# Altium schematic sheet Filtr_220.SchDoc
size B; SheetNumber: 8; SheetTotal: 9
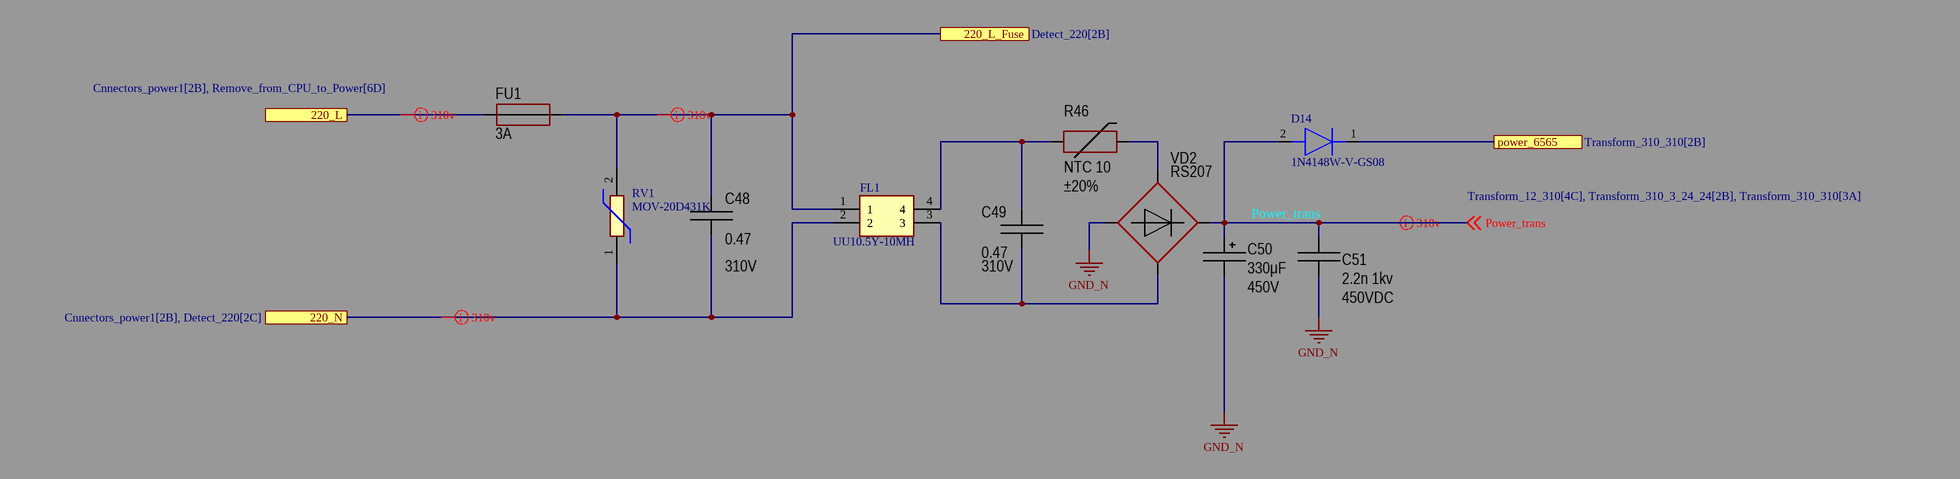
[diagram p0: Filtr_220.SchDoc]

## Parts
C48  value 0.47  Voltage: 310V  [CAP: B32922 (18x7x12.5mm)]
C49  value 0.47  Voltage: 310V  [CAP: B32922 (18x7x12.5mm)]
C50  value 330μF  Voltage: 450V  [CAP: D25C10H50]
C51  value 2.2n 1kv  Voltage: 450VDC  [CAP: AY2102M29Y5US63L7]
D14  1N4148W-V-GS08  [1N4148WVGS08]
FL1  UU10.5Y-10MH  [UU105Y10MH]
FU1  MaxCurrent: 3A  [FUSE: FC-001S]
R46  value NTC 10  Tolerance: ±20%  [RES: B57237 (NTC)]
RV1  MOV-20D431K  [MOV20D431K]
VD2  PartNumber: RS207  [DIODE: KBU6M]

## Ports
220_L (see Cnnectors_power1[2B], Remove_from_CPU_to_Power[6D]), 220_L_Fuse (see Detect_220[2B]), 220_N (see Cnnectors_power1[2B], Detect_220[2C]), power_6565 (see Transform_310_310[2B])

## Nets
GND_N: C50.2 C51.2 VD2.1
220_L: FU1.1 ; port 220_L
220_L_Fuse: C48.1 FL1.1 FU1.2 RV1.2 ; port 220_L_Fuse
220_N: C48.2 FL1.2 RV1.1 ; port 220_N
power_6565: D14.1(K) ; port power_6565
Power_trans: C50.1 C51.1 D14.2(A) VD2.3 ; off-sheet Power_trans
NetC49_1: C49.1 FL1.4 R46.1
NetC49_2: C49.2 FL1.3 VD2.4
NetR46_2: R46.2 VD2.2

## Layout directives
net class 310v: 220_L, 220_L_Fuse, 220_N, Power_trans

## Library data of the parts
C48 C49 = Film: Manufacturer: Epcos; PartNumber: B32774D4106K000; ValueManufacturerPartNumber: Film capacitor, 0.47, 310V, ±10%, 10.9mOhm, 31.5x15 mm, -40...+105°C; TypeCapacitor: Film capacitor; Tolerance: ±10%; Impedance: 10.9mOhm; Package: 31.5x15 mm; HelpURL: https://www.digikey.com/products/en/capacitors/film-capacitors/62?k=&pkeyword=&sv=0&pv2097=1958&sf=0&FV=fffc01ef%2C1f140000%2Cffe0003e%2Cffec6366&quantity=1&ColumnSort=1000011&page=1&stock=1&pageSize=25; Temperature: -40...+105°C
C50 = Aluminium: Manufacturer: Wurth; PartNumber: 860080475013; ValueManufacturerPartNumber: Aluminium capacitor, 330μF, 450V, ±20%, 54mOhm, 14x10x5 mm, -55...+105°C; TypeCapacitor: Aluminium capacitor; Tolerance: ±20%; Impedance: 54mOhm; Package: 14x10x5 mm; HelpURL: https://www.digikey.com/product-detail/en/wurth-electronics-inc/860080475013/732-9029-1-ND/5728972; Temperature: -55...+105°C
C51 = Film: Manufacturer: Epcos; PartNumber: B32774D4106K000; ValueManufacturerPartNumber: Film capacitor, 2.2n 1kv, 450VDC, ±10%, 10.9mOhm, 31.5x15 mm, -40...+105°C; TypeCapacitor: Film capacitor; Tolerance: ±10%; Impedance: 10.9mOhm; Package: 31.5x15 mm; HelpURL: https://www.digikey.com/products/en/capacitors/film-capacitors/62?k=&pkeyword=&sv=0&pv2097=1958&sf=0&FV=fffc01ef%2C1f140000%2Cffe0003e%2Cffec6366&quantity=1&ColumnSort=1000011&page=1&stock=1&pageSize=25; Temperature: -40...+105°C
D14 = 1N4148W-V-GS08: Diode; Manufacturer_Name: Vishay; Datasheet Link: https://us.rs-online.com/m/d/a2789c8794cb0c42ced29f2dd8571f3c.pdf; Height: 1.35mm; Manufacturer_Part_Number: 1N4148W-V-GS08; Mouser Part Number: 625-1N4148W-V; Mouser Price/Stock: https://www.mouser.co.uk/ProductDetail/Vishay-Semiconductors/1N4148W-V-GS08?qs=TNTIDjy6APrS%2Fdgq1RSs3A%3D%3D; Arrow Part Number: 1N4148W-V-GS08; Arrow Price/Stock: https://www.arrow.com/en/products/1n4148w-v-gs08/vishay
FL1 = UU10.5Y-10MH: Filter; Manufacturer_Name: FH(Guangdong Fenghua Advanced Tech); Datasheet Link: https://datasheet.lcsc.com/lcsc/2304140030_FH--Guangdong-Fenghua-Advanced-Tech-UU10-5Y-10mH_C75196.pdf; Height: 17mm; Manufacturer_Part_Number: UU10.5Y-10MH
FU1 = Fuse: Manufacturer: Littelfuse; PartNumber: 01110501Z; TypeFuse: Electromechanics relay; VoltageMax: 250VAC; Package: 5x20mm; HelpURL: https://www.digikey.com/products/en?keywords=01110501Z; ValueManufacturerPartNumber: =TypeFuse+', '+VoltageMax+', '+MaxCurrent+', '+Package+', '+Temperature
R46 = NTC: Manufacturer: Epcos; PartNumber: B57237S229M54; ValueManufacturerPartNumber: NTC resistor, NTC 10, ±20%, pitch 7.5mm, 7A, -55...+125°C; TypeResistor: NTC resistor; MaxCurrent: 7A; Package: pitch 7.5mm; HelpURL: https://www.digikey.com/product-detail/en/epcos-tdk/B57237S229M54/495-76635-1-ND/8126375; Temperature: -55...+125°C
RV1 = MOV-20D431K: Varistor; Manufacturer_Name: Bourns; Datasheet Link: https://www.bourns.com/data/global/pdfs/MOV20D.pdf; Height: 26mm; Manufacturer_Part_Number: MOV-20D431K; Mouser Part Number: 652-MOV-20D431K; Mouser Price/Stock: https://www.mouser.co.uk/ProductDetail/Bourns/MOV-20D431K?qs=CQ3B1E%252BbPs2R73OUL4kc5g%3D%3D; Arrow Part Number: MOV-20D431K; Arrow Price/Stock: https://www.arrow.com/en/products/mov-20d431k/bourns?utm_currency=USD&region=nac
VD2 = 1PH rectifier: Manufacturer: Comchip Technology; ValueManufacturerPartNumber: Single phase rectifier, 600V, 2A, 1.1V, 4-SMD, -55...+150°C; TypeDiode: Single phase rectifier; Voltage: 600V; Current: 2A; VoltageDrop: 1.1V; Package: 4-SMD; HelpURL: https://www.digikey.com/product-detail/en/comchip-technology/DF206ST-G/641-1425-1-ND/2208797; Temperature: -55...+150°C